# Altium schematic sheet ControlBoard.schdoc
size 297 x 209 mm; Symbol: Drawing-Symbol_A4; Company: 上海道尔汇控智能科技有限公司; Version: V1.2; Page Size: A4; @Project Name: YTM32; @Page Count: 1; @Update Date: 2025-12-09; @Create Date: 2025-10-20; @Schematic Name: YTM32_100pin; @Page No: 1; @Page Name: ControlBoard; @Create Time: 16:41:47; @Update Time: 21:45:52; Border: 1; Width: 1170; Height: 825; Region Start: 1; X Region Count: 6; Y Region Count: 4; Blade Width: 10; Title Block Position: 3; @Board Name: YTM32_100pin; Device: Drawing-Symbol_A4
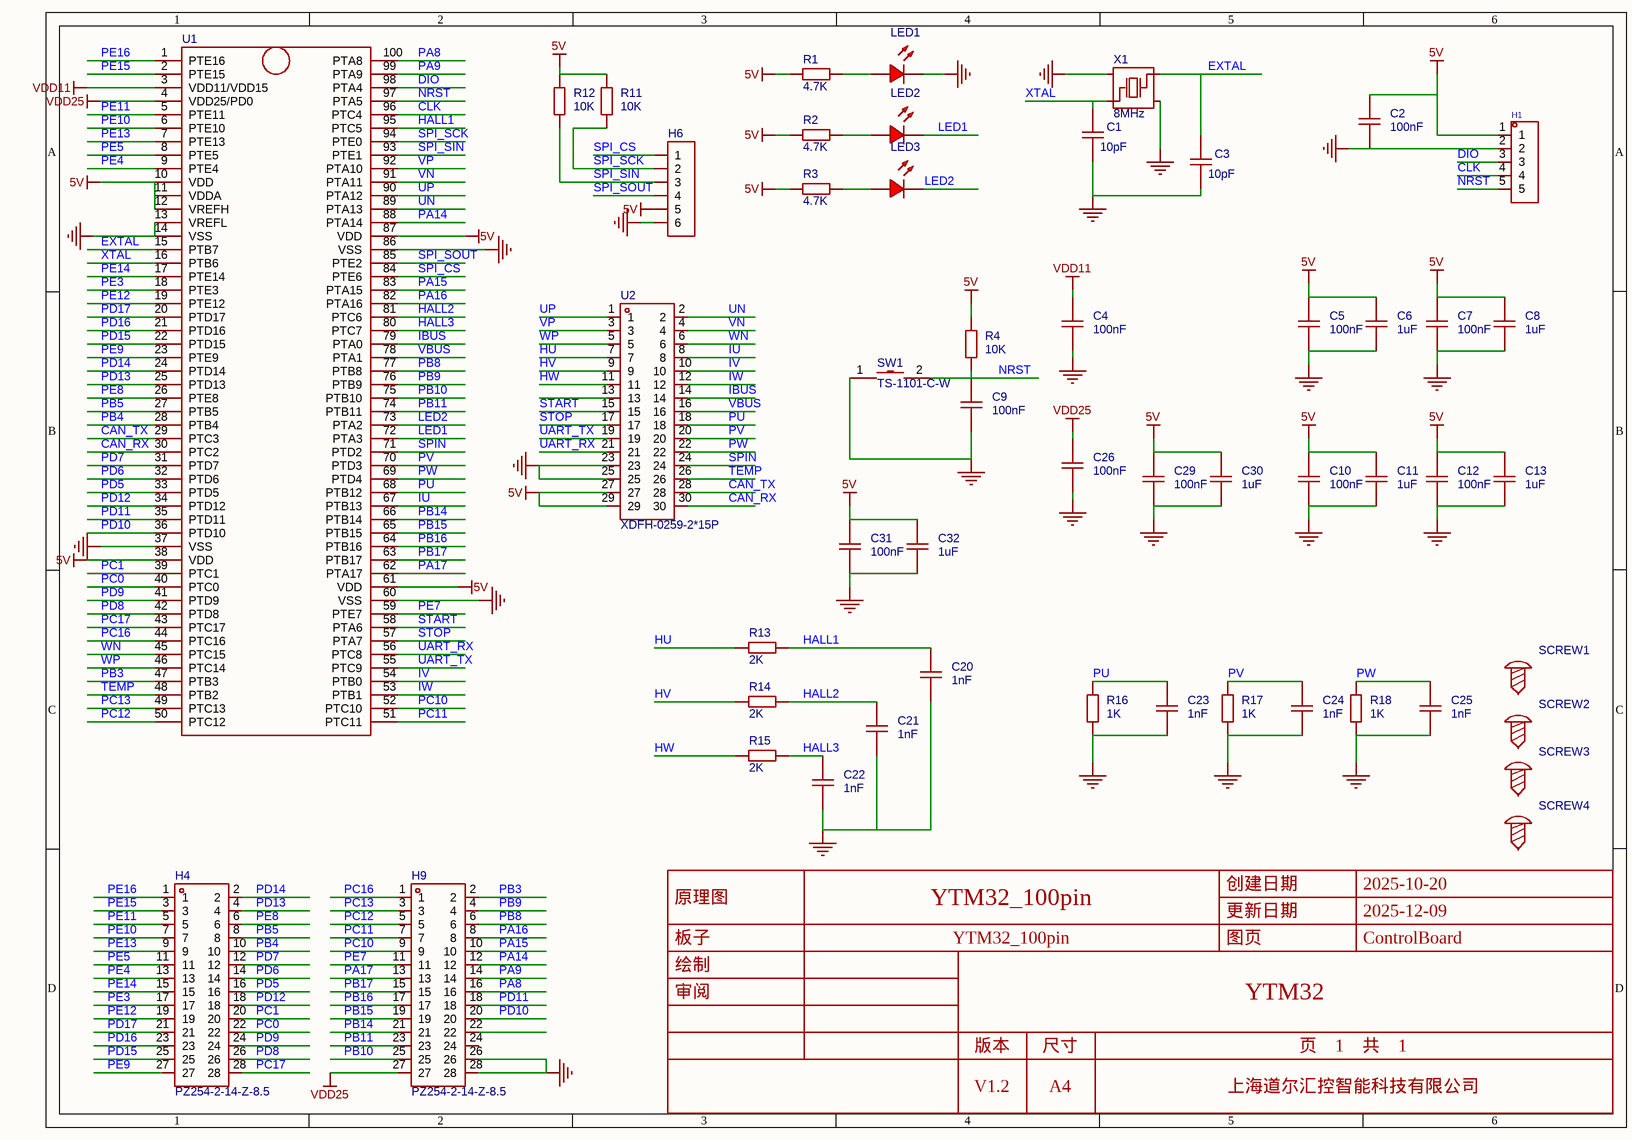
[diagram p0: ControlBoard.schdoc]

## Parts
C1  10pF  [C0603]
C2  100nF  [C0603]
C3  10pF  [C0603]
C4  100nF  [C0603]
C5  100nF  [C0603]
C6  1uF  [C0603]
C7  100nF  [C0603]
C8  1uF  [C0603]
C9  100nF  [C0603]
C10  100nF  [C0603]
C11  1uF  [C0603]
C12  100nF  [C0603]
C13  1uF  [C0603]
C20  1nF  [C0603]
C21  1nF  [C0603]
C22  1nF  [C0603]
C23  1nF  [C0603]
C24  1nF  [C0603]
C25  1nF  [C0603]
C26  100nF  [C0603]
C29  100nF  [C0603]
C30  1uF  [C0603]
C31  100nF  [C0603]
C32  1uF  [C0603]
H1  (no value)  [HDR-TH_5P-P2.54-V-M]
H4  PZ254-2-14-Z-8.5  [HDR-TH_28P-P2.54-V-M-R2-C14-S2.54]
H6  (no value)  [HDR-TH_6P-P2.54-V-M-1]
H9  PZ254-2-14-Z-8.5  [HDR-TH_28P-P2.54-V-M-R2-C14-S2.54]
LED1  (no value)  [LED_0603]
LED2  (no value)  [LED_0603]
LED3  (no value)  [LED_0603]
R1  4.7K  [R0603]
R2  4.7K  [R0603]
R3  4.7K  [R0603]
R4  10K  [R0603]
R11  10K  [R0603]
R12  10K  [R0603]
R13  2K  [R0603]
R14  2K  [R0603]
R15  2K  [R0603]
R16  1K  [R0603]
R17  1K  [R0603]
R18  1K  [R0603]
SCREW1  (no value)  [M3螺丝]
SCREW2  (no value)  [M3螺丝]
SCREW3  (no value)  [M3螺丝]
SCREW4  (no value)  [M3螺丝]
SW1  TS-1101-C-W  [SW-SMD_L6.0-W3.3-LS8.0]
U1  (no value)  [LQFP-100_L14.0-W14.0-P0.5-LS16.0-TL]
U2  XDFH-0259-2*15P  [CONN-TH_30P-P2.54_LX_XDFH-0259-2X15P]
X1  8MHz  [OSC-SMD_4P-L3.2-W2.5-BL]

## Nets
5V: C2.2 C5.2 C6.2 C7.2 C8.2 C10.2 C11.2 C12.2 C13.2 C29.2 C30.2 C31.2 C32.2 H1.1 H6.5 R1.1 R2.1 R3.1 R4.2 R11.2 R12.2 U1.10(VDD) U1.11(VDDA) U1.12(VREFH) U1.38(VDD) U1.61(VDD) U1.87(VDD) U2.27 U2.29
GND: C1.1 C2.1 C3.1 C4.1 C5.1 C6.1 C7.1 C8.1 C9.1 C10.1 C11.1 C12.1 C13.1 C20.1 C21.1 C22.1 C23.1 C24.1 C25.1 C26.1 C29.1 C30.1 C31.1 C32.1 H1.2 H6.6 H9.26 H9.28 LED1.1(C) R16.1 R17.1 R18.1 SW1.1 U1.13(VREFL) U1.14(VSS) U1.37(VSS) U1.60(VSS) U1.86(VSS) U2.23 U2.25 X1.2 X1.4
VDD11: C4.2 U1.3(VDD11/VDD15)
VDD25: C26.2 H9.27 U1.4(VDD25/PD0)
CAN_RX: U1.30(PTC2) U2.30
CAN_TX: U1.29(PTC3) U2.28
CLK: H1.4 U1.96(PTC4)
DIO: H1.3 U1.98(PTA4)
EXTAL: C3.2 U1.15(PTB7) X1.3
HALL1: C20.2 R13.2 U1.95(PTC5)
HALL2: C21.2 R14.2 U1.81(PTC6)
HALL3: C22.2 R15.2 U1.80(PTC7)
HU: R13.1 U2.7
HV: R14.1 U2.9
HW: R15.1 U2.11
IBUS: U1.79(PTA0) U2.14
IU: U1.67(PTB13) U2.8
IV: U1.54(PTB0) U2.10
IW: U1.53(PTB1) U2.12
LED1: LED2.1(C) U1.72(PTA3)
LED2: LED3.1(C) U1.73(PTA2)
NRST: C9.2 H1.5 R4.1 SW1.2 U1.97(PTA5)
PA8: H9.16 U1.100(PTA8)
PA9: H9.14 U1.99(PTA9)
PA14: H9.12 U1.88(PTA14)
PA15: H9.10 U1.83(PTA15)
PA16: H9.8 U1.82(PTA16)
PA17: H9.13 U1.62(PTA17)
PB3: H9.2 U1.47(PTB3)
PB4: H4.10 U1.28(PTB4)
PB5: H4.8 U1.27(PTB5)
PB8: H9.6 U1.77(PTB8)
PB9: H9.4 U1.76(PTB9)
PB10: H9.25 U1.75(PTB10)
PB11: H9.23 U1.74(PTB11)
PB14: H9.21 U1.66(PTB14)
PB15: H9.19 U1.65(PTB15)
PB16: H9.17 U1.64(PTB16)
PB17: H9.15 U1.63(PTB17)
PC0: H4.22 U1.40(PTC0)
PC1: H4.20 U1.39(PTC1)
PC10: H9.9 U1.52(PTC10)
PC11: H9.7 U1.51(PTC11)
PC12: H9.5 U1.50(PTC12)
PC13: H9.3 U1.49(PTC13)
PC16: H9.1 U1.44(PTC16)
PC17: H4.28 U1.43(PTC17)
PD5: H4.16 U1.33(PTD5)
PD6: H4.14 U1.32(PTD6)
PD7: H4.12 U1.31(PTD7)
PD8: H4.26 U1.42(PTD8)
PD9: H4.24 U1.41(PTD9)
PD10: H9.20 U1.36(PTD10)
PD11: H9.18 U1.35(PTD11)
PD12: H4.18 U1.34(PTD12)
PD13: H4.4 U1.25(PTD13)
PD14: H4.2 U1.24(PTD14)
PD15: H4.25 U1.22(PTD15)
PD16: H4.23 U1.21(PTD16)
PD17: H4.21 U1.20(PTD17)
PE3: H4.17 U1.18(PTE3)
PE4: H4.13 U1.9(PTE4)
PE5: H4.11 U1.8(PTE5)
PE7: H9.11 U1.59(PTE7)
PE8: H4.6 U1.26(PTE8)
PE9: H4.27 U1.23(PTE9)
PE10: H4.7 U1.6(PTE10)
PE11: H4.5 U1.5(PTE11)
PE12: H4.19 U1.19(PTE12)
PE13: H4.9 U1.7(PTE13)
PE14: H4.15 U1.17(PTE14)
PE15: H4.3 U1.2(PTE15)
PE16: H4.1 U1.1(PTE16)
PU: C23.2 R16.2 U1.68(PTB12) U2.18
PV: C24.2 R17.2 U1.70(PTD3) U2.20
PW: C25.2 R18.2 U1.69(PTD4) U2.22
SPI_CS: H6.1 U1.84(PTE6)
SPI_SCK: H6.2 R11.1 U1.94(PTE0)
SPI_SIN: H6.3 R12.1 U1.93(PTE1)
SPI_SOUT: H6.4 U1.85(PTE2)
SPIN: U1.71(PTD2) U2.24
START: U1.58(PTA6) U2.15
STOP: U1.57(PTA7) U2.17
TEMP: U1.48(PTB2) U2.26
UART_RX: U1.56(PTC8) U2.21
UART_TX: U1.55(PTC9) U2.19
UN: U1.89(PTA13) U2.2
UP: U1.90(PTA12) U2.1
VBUS: U1.78(PTA1) U2.16
VN: U1.91(PTA11) U2.4
VP: U1.92(PTA10) U2.3
WN: U1.45(PTC15) U2.6
WP: U1.46(PTC14) U2.5
XTAL: C1.2 U1.16(PTB6) X1.1
NetLED1_2: LED1.2(A) R1.2
NetLED2_2: LED2.2(A) R2.2
NetLED3_2: LED3.2(A) R3.2

Not connected (* = marked no-connect by the designer): H9 22 24; SCREW1 1; SCREW2 1; SCREW3 1; SCREW4 1; U2 13

## Notes on the sheet
- 创建日期
- 2025-10-20
- 原理图
- 板子
- YTM32_100pin
- 更新日期
- 图页
- 2025-12-09
- ControlBoard
- 绘制
- 审阅
- YTM32
- 版本
- V1.2
- 尺寸
- A4
- 页    1    共    1
- 上海道尔汇控智能科技有限公司

## Library data of the parts
C1-C13 C20-C26 C29-C32 = CAP_0603: ConvertToPcb: yes; SymbolName: CapAcitance; ModelId: ac125912035d415993ca9572d50418b1; ModelName: C0603_L1.6-W0.8-H0.8; ModelTransform: 62.992,31.496,0,0,0,0,0,0,0; Device: CAP_0603; AddInBom: yes; Supplier Footprint: 0603; FootprintName: C0603
  C1 C3: Value: 10pF
  C2 C4 C5 C7 C9 C10 C12 C26 C29 C31: Value: 100nF
  C6 C8 C11 C13 C30 C32: Value: 1uF
  C20-C25: Value: 1nF
H1 = HDR-M_2.54_1x5P: Manufacturer: MINTRON(明硕); Symbol: MTP125-1105S1; ConvertToPcb: yes; ModelId: 47d466e4a34f4fc5bc626cf773a24dd5; ModelName: HDR-TH_5P-P2.54-M-LI-1X5P; ModelTransform: 499.999,100,0,0,0,0,0,0,-118.11; Device: HDR-M_2.54_1x5P; Supplier: LCSC; Supplier Part: C358687; Manufacturer Part: MTP125-1105S1; JLCPCB Part Class: Extended Part; AddInBom: yes; Supplier Footprint: 插件; FootprintName: HDR-TH_5P-P2.54-V-M
H4 H9 = PZ254-2-14-Z-8.5: 插针结构:2x14P;间距:2.54mm;行距:2.54mm;圆针/方针:方针;安装类型:直插;排数:双排;总PIN位数:28P;额定电流:3A;额定电压:-;配合针长度:6mm;塑高:2.5mm;端接针长度:3mm;触头材质:黄铜;工作温度范围:-40℃~+105℃;焊接温度(最大值):260℃@10S;颜色:黑色;; Manufacturer: HCTL(华灿天禄); AddInBom: yes; ModelId: f5cba225e7a24f0b8a11ff318328260b; ModelTransform: 1400.037,196.85,0,0,0,0,0,0,-118.11; Pin Structure: 2x14P; Pitch: 2.54mm; Circluar Pins/Square Pins: 方针; Current Rating (Max): 3A; Symbol: PZ254-2-14-Z-8.5; Device: PZ254-2-14-Z-8.5; LCSC Part Name: 2x14P 间距:2.54mm 方针 直插; SupplierPart: C2894975; ManufacturerPart: PZ254-2-14-Z-8.5; Supplier Footprint: 插件,P=2.54mm; JLCPCB Part Class: 扩展库; Datasheet: https://atta.szlcsc.com/upload/public/pdf/source/20230609/5BA09C8BEB9B31376F8BF6032FF67CAC.pdf; Supplier: LCSC; ConvertToPcb: yes; FootprintName: HDR-TH_28P-P2.54-V-M-R2-C14-S2.54; ModelName: HDR-TH_28P-P2.54-V-M-R2-C14-S2.54; Row Spacing: 2.54mm; Mounting Type: 直插; Number of Rows: 双排; Number of Pins: 28P; Voltage Rating (Max): -; Length of Mating Pin: 6mm; Insulation Height: 2.5mm; Length of End Connection Pin: 3mm; Contact Material: 黄铜; Operating Temperature Range: -40℃~+105℃; Soldering Temperature(Max): 260℃@10S; Color: 黑色
H6 = HDR-M_2.54_1x6P: Symbol: Header-Male-2.54_1x6; ConvertToPcb: yes; ModelId: 60739dffc9b04830a286435b0fefbd4a; ModelName: HDR2.54-M-LI-1X6P; ModelTransform: 599.999,100,0,0,0,0,0,0,-118.11; Device: HDR-M_2.54_1x6P; AddInBom: yes; SupplierPart: C37208; Supplier Footprint: 插件; FootprintName: HDR-TH_6P-P2.54-V-M-1
LED1-LED3 = LED_0603-R: Symbol: LED_R; Convert to PCB: yes; 3D Model: dd8257b0d61a4cd7b68939a056e08095; 3D Model Transform: 58.72,29.4,22.03,0,0,0,0,0,0; ModelName: LED-0603_R; Device: LED_0603-R; Add into BOM: yes; Supplier Footprint: 0603; FootprintName: LED_0603
R1-R4 R11-R18 = Res_0603: Symbol: 电阻; ConvertToPcb: yes; ModelId: fc143cca1e79419f9cd78b61e9279f08; ModelTransform: 31.8897,63.7794,0,90,0,0,0,0,0; Device: Res_0603; AddInBom: yes; Supplier Footprint: 0603; FootprintName: R0603; ModelName: R0603
  R1-R3: Value: 4.7K
  R4 R11 R12: Value: 10K
  R13-R15: Value: 2K
  R16-R18: Value: 1K
SCREW1-SCREW4 = M3螺丝: ConvertToPcb: yes; SymbolName: 螺丝孔; Device: M3螺丝; AddInBom: yes; Supplier Footprint: 插件; FootprintName: M3螺丝
SW1 = TS-1101-C-W: 电路结构:单刀单掷;按钮形状:矩形按钮;作用力:260gf;安装方式:立贴;开关长度:6mm;开关宽度:3.6mm;开关高度:2.5mm;带支架:不带;触点电流:50mA;额定电压(AC):-;额定电压(DC):12V;额定功率:-;绝缘电阻:-;带灯:无;机械寿命:5万次;; Manufacturer: XKB Connectivity(中国星坤); AddInBom: yes; ModelId: b2f4ea9f0afc4b0786d53dba66ceb9e4; ModelName: SW-SMD_L6.0-W3.3-H5-LS8.0; ModelTransform: 314.96,129.921,0,0,0,0,0,0,0; Circuit: 单刀单掷; Actuator Style: 矩形按钮; Operating Force: 260gf; Switch Length: 6mm; Switch Width: 3.6mm; Switch Height: 2.5mm; Strike Gundam: 不带; Contact Current: 50mA; Voltage Rating (DC): 12V; Actuator/Cap Color: 白色带淡绿; With Lamp: 无; Mechanical Life: 5万次; Symbol: TS-1101-C-W; Device: TS-1101-C-W; LCSC Part Name: 6*3.6*2.5mm 立贴 轻触开关; SupplierPart: C318938; ManufacturerPart: TS-1101-C-W; Supplier Footprint: SMD; JLCPCB Part Class: 扩展库; Datasheet: https://atta.szlcsc.com/upload/public/pdf/source/20200227/C318938_C2E53B1EEDE37D980A33616AC086DE53.pdf; Supplier: LCSC; ConvertToPcb: yes; FootprintName: SW-SMD_L6.0-W3.3-LS8.0; Mounting Style: 立贴; Voltage Rating (AC): -; Power Rating: -; Insulation Resistance: -; IP Rating: -; Pin Style: -; Operating Temperature: -30℃~+85℃
U1 = YTM32B1ME0x_100pin: AddInBom: yes; Device: YTM32B1ME0x_100pin; SymbolName: YTM32B1ME0x_100pin; ConvertToPcb: yes; FootprintName: LQFP-100_L14.0-W14.0-P0.5-LS16.0-TL
U2 = XDFH-0259-2*15P: 连接器类型:简牛座;间距:2.54mm;结构:2x15P;额定电流:3A;额定电压:500V;封装形式:弯插;排数:2;每排PIN数:15;触头材质:铜;触头镀层:金;工作温度范围:-45℃~+105℃;; Manufacturer: LX(连欣科技); AddInBom: yes; ModelId: 5c3b8136d5a14d27ae11c9ec27ec7f0d; ModelTransform: 1799.209,492.9124,0,0,0,0,0,185.039,-129.921; Connector Type: 简牛座; Pitch: 2.54mm; Number of Positions or Pins: 2x15P; Current Rating: 3A; Voltage Rating (Max): 500V; Holder Type: 弯插; Number of PINs Per Row: 15; Symbol: XDFH-0259-2*15P; Device: XDFH-0259-2*15P; LCSC Part Name: 2U镀金PH2.54MM-2*15PIN卧插简牛插座专用; SupplierPart: C19193828; ManufacturerPart: XDFH-0259-2*15P; Supplier Footprint: 弯插,P=2.54mm; JLCPCB Part Class: 扩展库; Datasheet: https://atta.szlcsc.com/upload/public/pdf/source/20231117/460E6BB7C0FB7D45FB9AB0ED1A0F90C2.pdf; Supplier: LCSC; ConvertToPcb: yes; FootprintName: CONN-TH_30P-P2.54_LX_XDFH-0259-2X15P; ModelName: CONN-TH_30P-P2.54_LX_XDFH-0259-2X15P; Number of Rows: 2; Contact Material: 铜; Contact Plating: 金; Operating Temperature: -45℃~+105℃
X1 = TAXM8M4RDBCCT2T: 晶振类型:贴片晶振;频率:8MHz;常温频差:±10ppm;外接负载电容:10pF;频率稳定度(全温):±15ppm;; Manufacturer: YJX(雅晶鑫); AddInBom: yes; ModelId: ae22b8d143894765bc8100c37cb6356f; ModelName: OSC-SMD_4P-L3.2-W2.5-H1.0; ModelTransform: 125.984,98.425,0,0,0,0,0,0,0; Crystal Type: 贴片晶振; Normal temperature Frequency Tolerance: ±10ppm; External load capacitor: 10pF; Frequency Stability(Full temperature range): ±15ppm; Equivalent Series Resistance (ESR): 250Ω; Symbol: TAXM8M4RDBCCT2T; Device: TAXM8M4RDBCCT2T; LCSC Part Name: 8MHz ±10ppm 10pF; SupplierPart: C400090; ManufacturerPart: TAXM8M4RDBCCT2T; Supplier Footprint: SMD3225-4P; JLCPCB Part Class: 扩展库; Datasheet: https://atta.szlcsc.com/upload/public/pdf/source/20190626/C400090_CF95B89E745AFE4EF2E392EF8AC009D6.pdf; Supplier: LCSC; ConvertToPcb: yes; FootprintName: OSC-SMD_4P-L3.2-W2.5-BL; Value: 8MHz; Operating Temperature: -40℃~+85℃